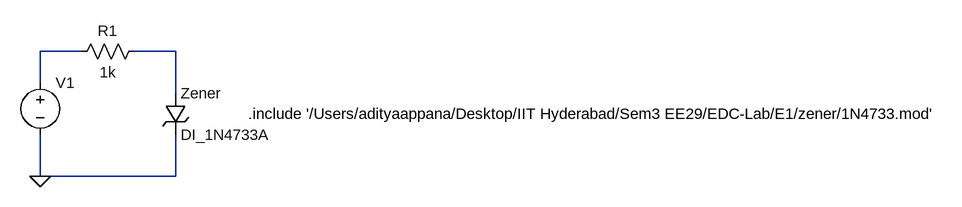
[diagram p0: schematic ReverseBiasZener.asc]
ReverseBiasZener.asc, the LTspice schematic file:
Version 4
SHEET 1 1932 680
WIRE 592 272 528 272
WIRE 736 272 672 272
WIRE 528 320 528 272
WIRE 736 336 736 272
WIRE 528 464 528 400
WIRE 736 464 736 400
WIRE 736 464 528 464
FLAG 528 464 0
SYMBOL zener 720 336 R0
SYMATTR InstName Zener
SYMATTR Value DI_1N4733A
SYMATTR Prefix X
SYMBOL voltage 528 304 R0
SYMATTR InstName V1
SYMATTR Value ""
SYMBOL Res 688 256 R90
WINDOW 0 0 56 VBottom 2
WINDOW 3 32 56 VTop 2
SYMATTR InstName R1
SYMATTR Value 1k
TEXT 848 368 Left 2 !.include '/Users/adityaappana/Desktop/IIT Hyderabad/Sem3 EE29/EDC-Lab/E1/zener/1N4733.mod'

The netlist it stands for:
* ReverseBiasZener.asc
XZener N002 0 DI_1N4733A  ; pins + -
V1 N001 0
R1 N002 N001 1k
.include '/Users/adityaappana/Desktop/IIT Hyderabad/Sem3 EE29/EDC-Lab/E1/zener/1N4733.mod'
.backanno
.end